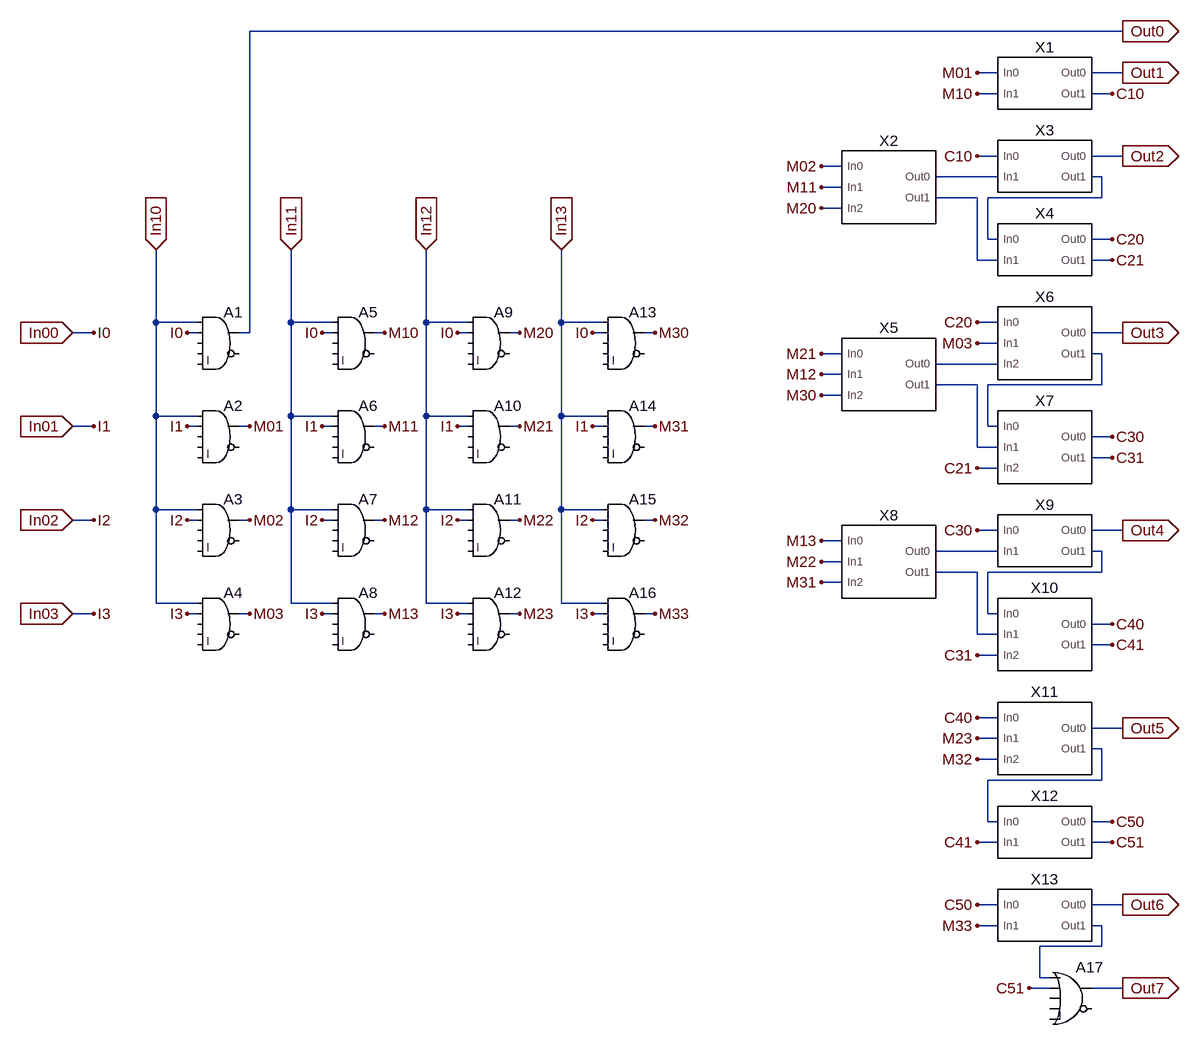
[diagram p0: schematic multiplier.asc]
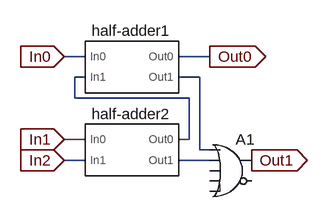
[diagram p1: sub-circuit full-adder.asc]
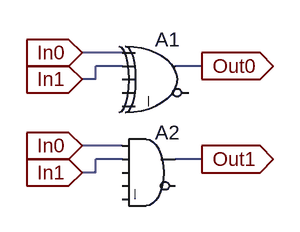
[diagram p2: sub-circuit half-adder.asc]
multiplier.asc, the LTspice schematic file:
Version 4.1
SHEET 1 1716 1916
WIRE 1600 -432 256 -432
WIRE 1408 -368 1376 -368
WIRE 1600 -368 1552 -368
WIRE 1408 -336 1376 -336
WIRE 1584 -336 1552 -336
WIRE 1408 -240 1376 -240
WIRE 1600 -240 1552 -240
WIRE 1168 -224 1136 -224
WIRE 1408 -208 1312 -208
WIRE 1568 -208 1552 -208
WIRE 1168 -192 1136 -192
WIRE 1376 -176 1312 -176
WIRE 1568 -176 1568 -208
WIRE 1568 -176 1392 -176
WIRE 1168 -160 1136 -160
WIRE 1392 -112 1392 -176
WIRE 1408 -112 1392 -112
WIRE 1584 -112 1552 -112
WIRE 1376 -80 1376 -176
WIRE 1408 -80 1376 -80
WIRE 1584 -80 1552 -80
WIRE 112 16 112 -96
WIRE 176 16 112 16
WIRE 320 16 320 -96
WIRE 384 16 320 16
WIRE 528 16 528 -96
WIRE 592 16 528 16
WIRE 736 16 736 -96
WIRE 800 16 736 16
WIRE 1408 16 1376 16
WIRE 16 32 -16 32
WIRE 176 32 160 32
WIRE 256 32 256 -432
WIRE 256 32 240 32
WIRE 384 32 368 32
WIRE 464 32 448 32
WIRE 592 32 576 32
WIRE 672 32 656 32
WIRE 800 32 784 32
WIRE 880 32 864 32
WIRE 1600 32 1552 32
WIRE 1408 48 1376 48
WIRE 1168 64 1136 64
WIRE 1568 64 1552 64
WIRE 1408 80 1312 80
WIRE 1168 96 1136 96
WIRE 1376 112 1312 112
WIRE 1568 112 1568 64
WIRE 1568 112 1392 112
WIRE 1168 128 1136 128
WIRE 112 160 112 16
WIRE 176 160 112 160
WIRE 320 160 320 16
WIRE 384 160 320 160
WIRE 528 160 528 16
WIRE 592 160 528 160
WIRE 736 160 736 16
WIRE 800 160 736 160
WIRE 16 176 -16 176
WIRE 176 176 160 176
WIRE 256 176 240 176
WIRE 384 176 368 176
WIRE 464 176 448 176
WIRE 592 176 576 176
WIRE 672 176 656 176
WIRE 800 176 784 176
WIRE 880 176 864 176
WIRE 1392 176 1392 112
WIRE 1408 176 1392 176
WIRE 1584 192 1552 192
WIRE 1376 208 1376 112
WIRE 1408 208 1376 208
WIRE 1584 224 1552 224
WIRE 1408 240 1376 240
WIRE 112 304 112 160
WIRE 176 304 112 304
WIRE 320 304 320 160
WIRE 384 304 320 304
WIRE 528 304 528 160
WIRE 592 304 528 304
WIRE 736 304 736 160
WIRE 800 304 736 304
WIRE 16 320 -16 320
WIRE 176 320 160 320
WIRE 256 320 240 320
WIRE 384 320 368 320
WIRE 464 320 448 320
WIRE 592 320 576 320
WIRE 672 320 656 320
WIRE 800 320 784 320
WIRE 880 320 864 320
WIRE 1408 336 1376 336
WIRE 1600 336 1552 336
WIRE 1168 352 1136 352
WIRE 1408 368 1312 368
WIRE 1568 368 1552 368
WIRE 1168 384 1136 384
WIRE 1376 400 1312 400
WIRE 1568 400 1568 368
WIRE 1568 400 1392 400
WIRE 1168 416 1136 416
WIRE 112 448 112 304
WIRE 176 448 112 448
WIRE 320 448 320 304
WIRE 384 448 320 448
WIRE 528 448 528 304
WIRE 592 448 528 448
WIRE 736 448 736 304
WIRE 800 448 736 448
WIRE 16 464 -16 464
WIRE 176 464 160 464
WIRE 256 464 240 464
WIRE 384 464 368 464
WIRE 464 464 448 464
WIRE 592 464 576 464
WIRE 672 464 656 464
WIRE 800 464 784 464
WIRE 880 464 864 464
WIRE 1392 464 1392 400
WIRE 1408 464 1392 464
WIRE 1584 480 1552 480
WIRE 1376 496 1376 400
WIRE 1408 496 1376 496
WIRE 1584 512 1552 512
WIRE 1408 528 1376 528
WIRE 1408 624 1376 624
WIRE 1600 640 1552 640
WIRE 1408 656 1376 656
WIRE 1568 672 1552 672
WIRE 1408 688 1376 688
WIRE 1568 720 1568 672
WIRE 1568 720 1392 720
WIRE 1392 784 1392 720
WIRE 1408 784 1392 784
WIRE 1584 784 1552 784
WIRE 1408 816 1376 816
WIRE 1584 816 1552 816
WIRE 1408 912 1376 912
WIRE 1600 912 1552 912
WIRE 1408 944 1376 944
WIRE 1568 944 1552 944
WIRE 1568 976 1568 944
WIRE 1568 976 1472 976
WIRE 1472 1024 1472 976
WIRE 1488 1024 1472 1024
WIRE 1488 1040 1456 1040
WIRE 1600 1040 1552 1040
FLAG 160 32 I0
FLAG 16 32 I0
FLAG 160 176 I1
FLAG 160 320 I2
FLAG 160 464 I3
FLAG 16 176 I1
FLAG 16 320 I2
FLAG 16 464 I3
FLAG 368 32 I0
FLAG 368 176 I1
FLAG 368 320 I2
FLAG 368 464 I3
FLAG 576 32 I0
FLAG 576 176 I1
FLAG 576 320 I2
FLAG 576 464 I3
FLAG 784 32 I0
FLAG 784 176 I1
FLAG 784 320 I2
FLAG 784 464 I3
FLAG 256 176 M01
FLAG 256 320 M02
FLAG 256 464 M03
FLAG 464 32 M10
FLAG 464 176 M11
FLAG 464 320 M12
FLAG 464 464 M13
FLAG 672 32 M20
FLAG 672 176 M21
FLAG 672 320 M22
FLAG 672 464 M23
FLAG 880 32 M30
FLAG 880 176 M31
FLAG 880 320 M32
FLAG 880 464 M33
FLAG 1600 -432 Out0
IOPIN 1600 -432 Out
FLAG 1600 -368 Out1
IOPIN 1600 -368 Out
FLAG 1600 -240 Out2
IOPIN 1600 -240 Out
FLAG -16 32 In00
IOPIN -16 32 In
FLAG -16 176 In01
IOPIN -16 176 In
FLAG -16 320 In02
IOPIN -16 320 In
FLAG -16 464 In03
IOPIN -16 464 In
FLAG 112 -96 In10
IOPIN 112 -96 In
FLAG 320 -96 In11
IOPIN 320 -96 In
FLAG 528 -96 In12
IOPIN 528 -96 In
FLAG 736 -96 In13
IOPIN 736 -96 In
FLAG 1376 -368 M01
FLAG 1376 -336 M10
FLAG 1584 -336 C10
FLAG 1600 32 Out3
IOPIN 1600 32 Out
FLAG 1376 -240 C10
FLAG 1136 -224 M02
FLAG 1136 -192 M11
FLAG 1136 -160 M20
FLAG 1584 -112 C20
FLAG 1584 -80 C21
FLAG 1376 16 C20
FLAG 1376 48 M03
FLAG 1376 240 C21
FLAG 1136 64 M21
FLAG 1136 96 M12
FLAG 1136 128 M30
FLAG 1584 192 C30
FLAG 1584 224 C31
FLAG 1600 336 Out4
IOPIN 1600 336 Out
FLAG 1376 336 C30
FLAG 1136 352 M13
FLAG 1136 384 M22
FLAG 1136 416 M31
FLAG 1584 480 C40
FLAG 1584 512 C41
FLAG 1376 528 C31
FLAG 1376 624 C40
FLAG 1376 816 C41
FLAG 1376 656 M23
FLAG 1376 688 M32
FLAG 1600 640 Out5
IOPIN 1600 640 Out
FLAG 1584 784 C50
FLAG 1584 816 C51
FLAG 1600 912 Out6
IOPIN 1600 912 Out
FLAG 1600 1040 Out7
IOPIN 1600 1040 Out
FLAG 1376 912 C50
FLAG 1456 1040 C51
FLAG 1376 944 M33
SYMBOL Digital\\and 208 -16 R0
SYMATTR InstName A1
SYMBOL Digital\\and 208 128 R0
SYMATTR InstName A2
SYMBOL Digital\\and 208 272 R0
SYMATTR InstName A3
SYMBOL Digital\\and 208 416 R0
SYMATTR InstName A4
SYMBOL Digital\\and 416 -16 R0
SYMATTR InstName A5
SYMBOL Digital\\and 416 128 R0
SYMATTR InstName A6
SYMBOL Digital\\and 416 272 R0
SYMATTR InstName A7
SYMBOL Digital\\and 416 416 R0
SYMATTR InstName A8
SYMBOL Digital\\and 624 -16 R0
SYMATTR InstName A9
SYMBOL Digital\\and 624 128 R0
SYMATTR InstName A10
SYMBOL Digital\\and 624 272 R0
SYMATTR InstName A11
SYMBOL Digital\\and 624 416 R0
SYMATTR InstName A12
SYMBOL Digital\\and 832 -16 R0
SYMATTR InstName A13
SYMBOL Digital\\and 832 128 R0
SYMATTR InstName A14
SYMBOL Digital\\and 832 272 R0
SYMATTR InstName A15
SYMBOL Digital\\and 832 416 R0
SYMATTR InstName A16
SYMBOL full-adder 1232 -192 R0
SYMATTR InstName X2
SYMBOL half-adder 1472 -224 R0
SYMATTR InstName X3
SYMBOL half-adder 1472 -96 R0
SYMATTR InstName X4
SYMBOL full-adder 1472 48 R0
SYMATTR InstName X6
SYMBOL full-adder 1232 96 R0
SYMATTR InstName X5
SYMBOL full-adder 1472 208 R0
SYMATTR InstName X7
SYMBOL full-adder 1232 384 R0
SYMATTR InstName X8
SYMBOL half-adder 1472 352 R0
SYMATTR InstName X9
SYMBOL full-adder 1472 496 R0
SYMATTR InstName X10
SYMBOL full-adder 1472 656 R0
SYMATTR InstName X11
SYMBOL half-adder 1472 800 R0
SYMATTR InstName X12
SYMBOL half-adder 1472 928 R0
SYMATTR InstName X13
SYMBOL Digital\\or 1520 992 R0
SYMATTR InstName A17
SYMBOL half-adder 1472 -352 R0
SYMATTR InstName X1

full-adder.asc, the sub-circuit schematic file:
Version 4.1
SHEET 1 880 680
WIRE 64 96 32 96
WIRE 256 96 208 96
WIRE 64 128 48 128
WIRE 240 128 208 128
WIRE 48 160 48 128
WIRE 224 160 48 160
WIRE 64 224 32 224
WIRE 224 224 224 160
WIRE 224 224 208 224
WIRE 240 240 240 128
WIRE 256 240 240 240
WIRE 64 256 32 256
WIRE 256 256 208 256
FLAG 32 96 In0
IOPIN 32 96 In
FLAG 32 224 In1
IOPIN 32 224 In
FLAG 32 256 In2
IOPIN 32 256 In
FLAG 256 96 Out0
IOPIN 256 96 Out
FLAG 320 256 Out1
IOPIN 320 256 Out
SYMBOL half-adder 128 112 R0
SYMATTR InstName half-adder1
SYMBOL half-adder 128 240 R0
SYMATTR InstName half-adder2
SYMBOL Digital\\or 288 208 R0
SYMATTR InstName A1

half-adder.asc, the sub-circuit schematic file:
Version 4.1
SHEET 1 880 680
WIRE 144 112 96 112
WIRE 144 128 112 128
WIRE 240 128 208 128
WIRE 112 144 112 128
WIRE 112 144 96 144
WIRE 144 224 96 224
WIRE 144 240 112 240
WIRE 240 240 208 240
WIRE 112 256 112 240
WIRE 112 256 96 256
FLAG 96 112 In0
IOPIN 96 112 In
FLAG 96 144 In1
IOPIN 96 144 In
FLAG 240 128 Out0
IOPIN 240 128 Out
FLAG 96 224 In0
IOPIN 96 224 In
FLAG 96 256 In1
IOPIN 96 256 In
FLAG 240 240 Out1
IOPIN 240 240 Out
SYMBOL Digital\\xor 192 80 R0
SYMATTR InstName A1
SYMBOL Digital\\and 176 192 R0
SYMATTR InstName A2

The netlist it stands for:
* multiplier.asc
A1 In10 In00 0 0 0 0 Out0 0 AND
A2 In10 In01 0 0 0 0 M01 0 AND
A3 In10 In02 0 0 0 0 M02 0 AND
A4 In10 In03 0 0 0 0 M03 0 AND
A5 In11 In00 0 0 0 0 M10 0 AND
A6 In11 In01 0 0 0 0 M11 0 AND
A7 In11 In02 0 0 0 0 M12 0 AND
A8 In11 In03 0 0 0 0 M13 0 AND
A9 In12 In00 0 0 0 0 M20 0 AND
A10 In12 In01 0 0 0 0 M21 0 AND
A11 In12 In02 0 0 0 0 M22 0 AND
A12 In12 In03 0 0 0 0 M23 0 AND
A13 In13 In00 0 0 0 0 M30 0 AND
A14 In13 In01 0 0 0 0 M31 0 AND
A15 In13 In02 0 0 0 0 M32 0 AND
A16 In13 In03 0 0 0 0 M33 0 AND
X§X2 M02 M11 M20 N001 N003 full-adder
X§X3 C10 N001 Out2 N002 half-adder
X§X4 N002 N003 C20 C21 half-adder
X§X6 C20 M03 N005 Out3 N004 full-adder
X§X5 M21 M12 M30 N005 N006 full-adder
X§X7 N004 N006 C21 C30 C31 full-adder
X§X8 M13 M22 M31 N007 N009 full-adder
X§X9 C30 N007 Out4 N008 half-adder
X§X10 N008 N009 C31 C40 C41 full-adder
X§X11 C40 M23 M32 Out5 N010 full-adder
X§X12 N010 C41 C50 C51 half-adder
X§X13 C50 M33 Out6 N011 half-adder
A17 N011 C51 0 0 0 0 Out7 0 OR
X§X1 M01 M10 Out1 C10 half-adder

* block symbol definitions
.subckt full-adder In0 In1 In2 Out0 Out1
X§half-adder1 In0 N001 Out0 N002 half-adder
X§half-adder2 In1 In2 N001 N003 half-adder
A1 N002 N003 0 0 0 0 Out1 0 OR
.ends full-adder

.subckt half-adder In0 In1 Out0 Out1
A1 In0 In1 0 0 0 0 Out0 0 XOR
A2 In0 In1 0 0 0 0 Out1 0 AND
.ends half-adder

.backanno
.end